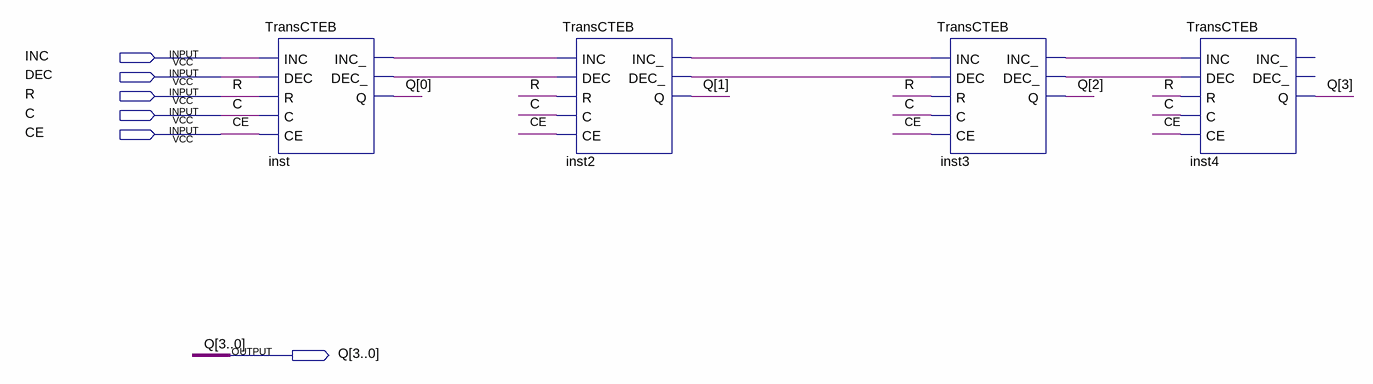
[diagram p0: schematic sheet]
// Quartus schematic CT.bdf as structural Verilog: 4 symbols, 6 pins
module CT (
  input  INC,
  input  DEC,
  input  R,
  input  C,
  input  CE,
  output [3:0] Q
);

  wire inst2_dec_, inst2_inc_, inst3_dec_, inst3_inc_, inst_dec_, inst_inc_;

  TransCTEB inst (.INC(INC), .DEC(DEC), .R(R), .C(C), .CE(CE), .INC_(inst_inc_), .DEC_(inst_dec_), .Q(Q[0]));
  TransCTEB inst2 (
    .INC(inst_inc_), .DEC(inst_dec_), .R(R), .C(C), .CE(CE), .INC_(inst2_inc_), .DEC_(inst2_dec_), .Q(Q[1]));
  TransCTEB inst3 (
    .INC(inst2_inc_), .DEC(inst2_dec_), .R(R), .C(C), .CE(CE), .INC_(inst3_inc_), .DEC_(inst3_dec_), .Q(Q[2]));
  TransCTEB inst4 (.INC(inst3_inc_), .DEC(inst3_dec_), .R(R), .C(C), .CE(CE), .Q(Q[3]));  // open: INC_, DEC_
endmodule
